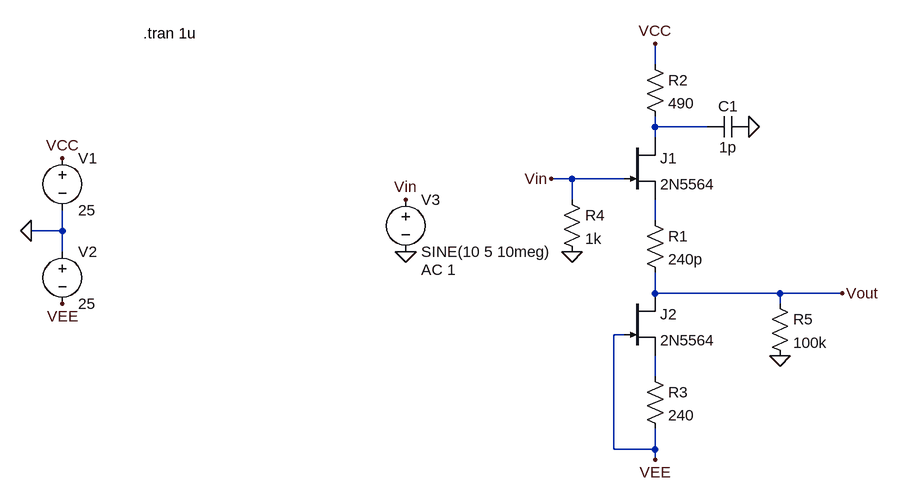
[diagram p0: schematic buffer_amp.asc]
buffer_amp.asc, the LTspice schematic file:
Version 4
SHEET 1 880 680
WIRE 352 -80 352 -112
WIRE 352 16 352 0
WIRE 432 16 352 16
WIRE 352 32 352 16
WIRE 224 96 192 96
WIRE 304 96 224 96
WIRE 224 128 224 96
WIRE 352 160 352 128
WIRE -560 176 -560 144
WIRE -560 176 -608 176
WIRE -560 208 -560 176
WIRE 352 272 352 240
WIRE 544 272 352 272
WIRE 640 272 544 272
WIRE 544 288 544 272
WIRE 304 336 288 336
WIRE 352 400 352 368
WIRE 288 512 288 336
WIRE 352 512 352 480
WIRE 352 512 288 512
WIRE 352 528 352 512
FLAG -608 176 0
FLAG -560 64 VCC
FLAG -560 288 VEE
FLAG 352 -112 VCC
FLAG 352 528 VEE
FLAG 224 208 0
FLAG 496 16 0
FLAG 192 96 Vin
FLAG 640 272 Vout
FLAG 544 368 0
FLAG -32 208 0
FLAG -32 128 Vin
SYMBOL voltage -560 48 R0
WINDOW 123 0 0 Left 0
WINDOW 39 0 0 Left 0
SYMATTR InstName V1
SYMATTR Value 25
SYMBOL voltage -560 192 R0
WINDOW 123 0 0 Left 0
WINDOW 39 0 0 Left 0
SYMATTR InstName V2
SYMATTR Value 25
SYMBOL njf 304 32 R0
SYMATTR InstName J1
SYMATTR Value 2N5564
SYMBOL njf 304 272 R0
SYMATTR InstName J2
SYMATTR Value 2N5564
SYMBOL res 336 144 R0
SYMATTR InstName R1
SYMATTR Value 240p
SYMBOL res 336 -96 R0
SYMATTR InstName R2
SYMATTR Value 490
SYMBOL res 336 384 R0
SYMATTR InstName R3
SYMATTR Value 240
SYMBOL res 208 112 R0
SYMATTR InstName R4
SYMATTR Value 1k
SYMBOL res 528 272 R0
SYMATTR InstName R5
SYMATTR Value 100k
SYMBOL cap 496 0 R90
WINDOW 0 0 32 VBottom 2
WINDOW 3 32 32 VTop 2
SYMATTR InstName C1
SYMATTR Value 1p
SYMBOL voltage -32 112 R0
WINDOW 123 24 124 Left 2
WINDOW 39 0 0 Left 0
SYMATTR InstName V3
SYMATTR Value SINE(10 5 10meg)
SYMATTR Value2 AC 1
TEXT -436 -128 Left 2 !.tran 1u

The netlist it stands for:
* buffer_amp.asc
V1 VCC 0 25
V2 0 VEE 25
J1 N001 Vin N002 2N5564
J2 Vout VEE N003 2N5564
R1 N002 Vout 240p
R2 VCC N001 490
R3 N003 VEE 240
R4 Vin 0 1k
R5 Vout 0 100k
C1 0 N001 1p
V3 Vin 0 SINE(10 5 10meg) AC 1
.model NJF NJF
.model PJF PJF
.lib standard.jft
.tran 1u
.backanno
.end